# Altium schematic sheet TPS5450DDAR1_TPS5450DDAR.schdoc
size 127 x 99 mm
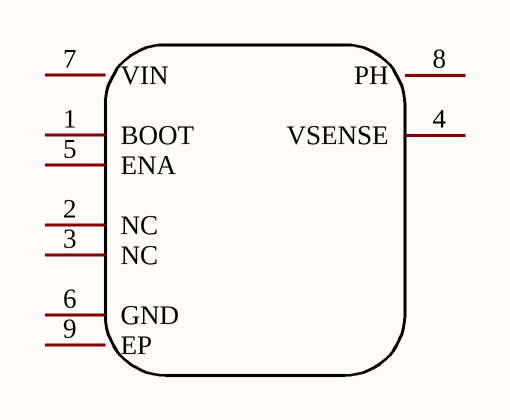
[diagram p0: TPS5450DDAR1_TPS5450DDAR.schdoc]

## Parts
U?  TPS5450DDAR  (value not drawn)

## Nets

Not connected (* = marked no-connect by the designer): U? 1(BOOT) 2(NC) 3(NC) 4(VSENSE) 5(ENA) 6(GND) 7(VIN) 8(PH) 9(EP)

## Library data of the parts
U? = TPS5450DDAR: Manufacturer: TI(德州仪器); Add into BOM: yes; Function: 降压型; Name: TPS5450DDAR; Symbol: TPS5450DDAR; Device: TPS5450DDAR; LCSC Part Name: TPS5450DDAR; Supplier Part: C114425; Manufacturer Part: TPS5450DDAR; Supplier Footprint: SOP-8_EP_150mil; JLCPCB Part Class: Extended Part; Datasheet: https://atta.szlcsc.com/upload/public/pdf/source/20170620/1497944765773.pdf; Supplier: LCSC; Convert to PCB: yes; Synchronous Rectification: -; Number of Outputs: -; Topology: -; Input Voltage: -; Switching Frequency: -; Output Current (Max): -